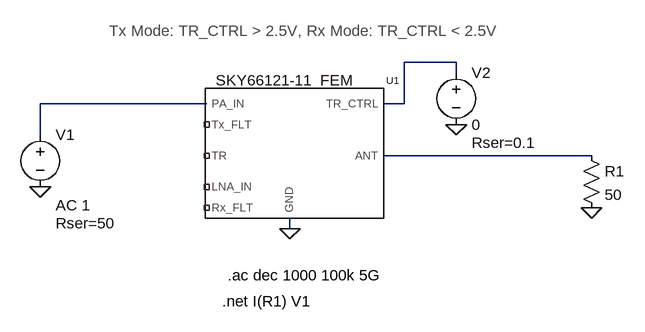
[diagram p0: schematic SKY66122-11_FEM.asc]
SKY66122-11_FEM.asc, the LTspice schematic file:
Version 4.1
SHEET 1 880 680
WIRE 496 64 416 64
WIRE 496 80 496 64
WIRE 112 128 -144 128
WIRE 416 128 416 64
WIRE 416 128 384 128
WIRE -144 176 -144 128
WIRE 704 208 384 208
WIRE 240 320 240 304
FLAG 240 320 0
FLAG -144 256 0
FLAG 496 160 0
FLAG 704 288 0
SYMBOL Spice_Models\\SKY66121-11_FEM 240 176 R0
SYMATTR InstName U1
SYMBOL voltage -144 160 R0
WINDOW 123 24 124 Left 2
WINDOW 39 24 152 Left 2
SYMATTR InstName V1
SYMATTR Value ""
SYMATTR Value2 AC 1
SYMATTR SpiceLine Rser=50
SYMBOL voltage 496 64 R0
WINDOW 123 0 0 Left 0
WINDOW 39 24 124 Left 2
SYMATTR InstName V2
SYMATTR Value 0
SYMATTR SpiceLine Rser=0.1
SYMBOL res 688 192 R0
SYMATTR InstName R1
SYMATTR Value 50
TEXT 144 392 Left 2 !.ac dec 1000 100k 5G
TEXT 136 432 Left 2 !.net I(R1) V1

The netlist it stands for:
* SKY66122-11_FEM.asc
X§U1 NC_01 N002 NC_02 NC_03 NC_04 N003 N001 0 SKY66121-11_FEM  ; pins TR PA_IN Tx_FLT LNA_IN Rx_FLT ANT TR_CTRL GND
V1 N002 0 AC 1 Rser=50
V2 N001 0 0 Rser=0.1
R1 N003 0 50
.ac dec 1000 100k 5G
.net I(R1) V1
.lib SKY66122-11.lib
.backanno
.end